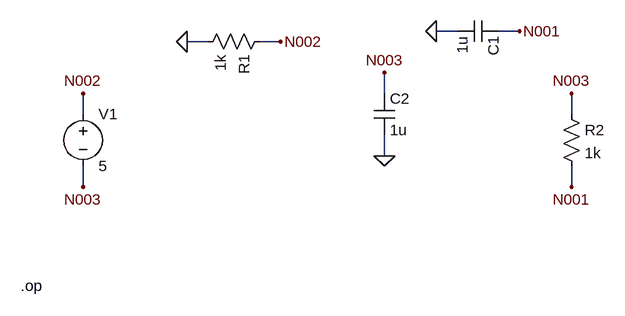
[diagram p0: schematic C11_D1_P1.asc]
C11_D1_P1.asc, the LTspice schematic file:
Version 4
SHEET 1 1232 680
WIRE 736 128 704 128
WIRE 352 144 320 144
WIRE 624 288 624 320
WIRE 800 128 832 128
WIRE 912 336 912 368
WIRE 432 144 464 144
WIRE 160 256 160 224
WIRE 624 224 624 192
WIRE 160 336 160 368
WIRE 912 256 912 224
FLAG 704 128 0
FLAG 320 144 0
FLAG 624 320 0
FLAG 832 128 N001
FLAG 912 368 N001
FLAG 464 144 N002
FLAG 160 224 N002
FLAG 624 192 N003
FLAG 160 368 N003
FLAG 912 224 N003
SYMBOL cap 800 112 R90
SYMATTR InstName C1
SYMATTR Value 1u
SYMBOL res 448 128 R90
SYMATTR InstName R1
SYMATTR Value 1k
SYMBOL cap 608 224 R0
SYMATTR InstName C2
SYMATTR Value 1u
SYMBOL voltage 160 240 R0
SYMATTR InstName V1
SYMATTR Value 5
SYMBOL res 896 240 R0
SYMATTR InstName R2
SYMATTR Value 1k
TEXT 64 520 Left 2 !.op

The netlist it stands for:
* C11_D1_P1.asc
C1 N001 0 1u
R1 N002 0 1k
C2 N003 0 1u
V1 N002 N003 5
R2 N003 N001 1k
.op
.backanno
.end